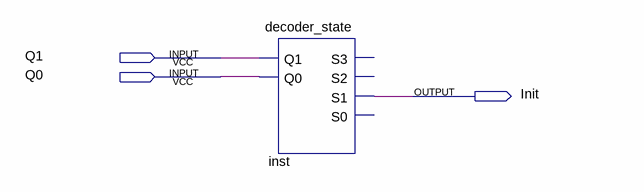
[diagram p0: schematic sheet]
// Quartus schematic Init.bdf as structural Verilog: 1 symbols, 3 pins
module Init (
  input  Q1,
  input  Q0,
  output Init
);

  decoder_state inst (.Q1(Q1), .Q0(Q0), .S1(Init));  // open: S3, S2, S0
endmodule
